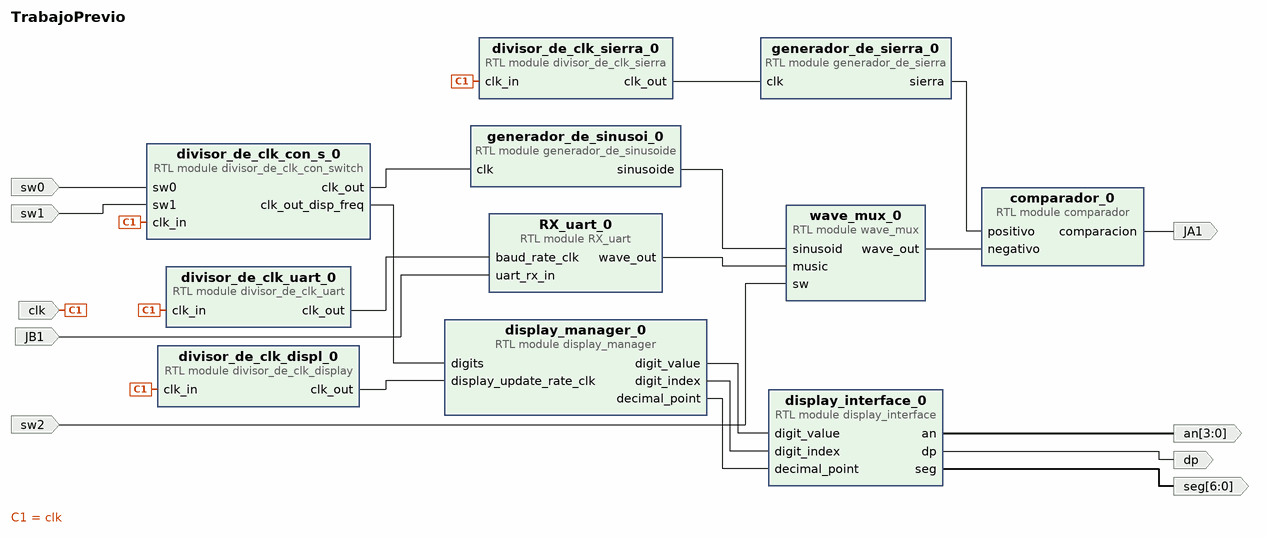
[diagram p0: block diagram of the top level]
# Vivado block design TrabajoPrevio, xc7a35tcpg236-1, Vivado 2020.1
create_bd_design TrabajoPrevio

create_bd_port -dir I clk
create_bd_port -dir I sw0
create_bd_port -dir I sw1
create_bd_port -dir O -from 6 -to 0 seg
create_bd_port -dir O dp
create_bd_port -dir O -from 3 -to 0 an
create_bd_port -dir I JB1
create_bd_port -dir I sw2
create_bd_port -dir O JA1

create_bd_cell -type module -reference comparador comparador_0
create_bd_cell -type module -reference generador_de_sinusoide generador_de_sinusoi_0
create_bd_cell -type module -reference generador_de_sierra generador_de_sierra_0
create_bd_cell -type module -reference display_manager display_manager_0
create_bd_cell -type module -reference display_interface display_interface_0
create_bd_cell -type module -reference divisor_de_clk_display divisor_de_clk_displ_0
create_bd_cell -type module -reference divisor_de_clk_con_switch divisor_de_clk_con_s_0
create_bd_cell -type module -reference divisor_de_clk_sierra divisor_de_clk_sierra_0
create_bd_cell -type module -reference RX_uart RX_uart_0
create_bd_cell -type module -reference divisor_de_clk_uart divisor_de_clk_uart_0
create_bd_cell -type module -reference wave_mux wave_mux_0

# ---- connections ----

connect_bd_net [get_bd_pins generador_de_sierra_0/sierra] [get_bd_pins comparador_0/positivo]
connect_bd_net [get_bd_ports clk] \
  [get_bd_pins divisor_de_clk_displ_0/clk_in] [get_bd_pins divisor_de_clk_con_s_0/clk_in] \
  [get_bd_pins divisor_de_clk_sierra_0/clk_in] [get_bd_pins divisor_de_clk_uart_0/clk_in]
connect_bd_net [get_bd_pins display_manager_0/digit_value] [get_bd_pins display_interface_0/digit_value]
connect_bd_net [get_bd_pins display_manager_0/digit_index] [get_bd_pins display_interface_0/digit_index]
connect_bd_net [get_bd_pins display_manager_0/decimal_point] [get_bd_pins display_interface_0/decimal_point]
connect_bd_net [get_bd_pins display_interface_0/seg] [get_bd_ports seg]
connect_bd_net [get_bd_pins display_interface_0/dp] [get_bd_ports dp]
connect_bd_net [get_bd_pins display_interface_0/an] [get_bd_ports an]
connect_bd_net [get_bd_pins divisor_de_clk_displ_0/clk_out] [get_bd_pins display_manager_0/display_update_rate_clk]
connect_bd_net -net sw0_1 [get_bd_ports sw0] [get_bd_pins divisor_de_clk_con_s_0/sw0]
connect_bd_net -net sw1_1 [get_bd_ports sw1] [get_bd_pins divisor_de_clk_con_s_0/sw1]
connect_bd_net [get_bd_pins divisor_de_clk_con_s_0/clk_out] [get_bd_pins generador_de_sinusoi_0/clk]
connect_bd_net [get_bd_pins divisor_de_clk_con_s_0/clk_out_disp_freq] [get_bd_pins display_manager_0/digits]
connect_bd_net [get_bd_pins divisor_de_clk_sierra_0/clk_out] [get_bd_pins generador_de_sierra_0/clk]
connect_bd_net [get_bd_pins divisor_de_clk_uart_0/clk_out] [get_bd_pins RX_uart_0/baud_rate_clk]
connect_bd_net -net uart_rx_in_0_1 [get_bd_ports JB1] [get_bd_pins RX_uart_0/uart_rx_in]
connect_bd_net [get_bd_pins wave_mux_0/wave_out] [get_bd_pins comparador_0/negativo]
connect_bd_net [get_bd_pins generador_de_sinusoi_0/sinusoide] [get_bd_pins wave_mux_0/sinusoid]
connect_bd_net [get_bd_pins RX_uart_0/wave_out] [get_bd_pins wave_mux_0/music]
connect_bd_net -net sw_0_1 [get_bd_ports sw2] [get_bd_pins wave_mux_0/sw]
connect_bd_net [get_bd_pins comparador_0/comparacion] [get_bd_ports JA1]

validate_bd_design
save_bd_design
